# Altium project PCB_Project.PrjPcb
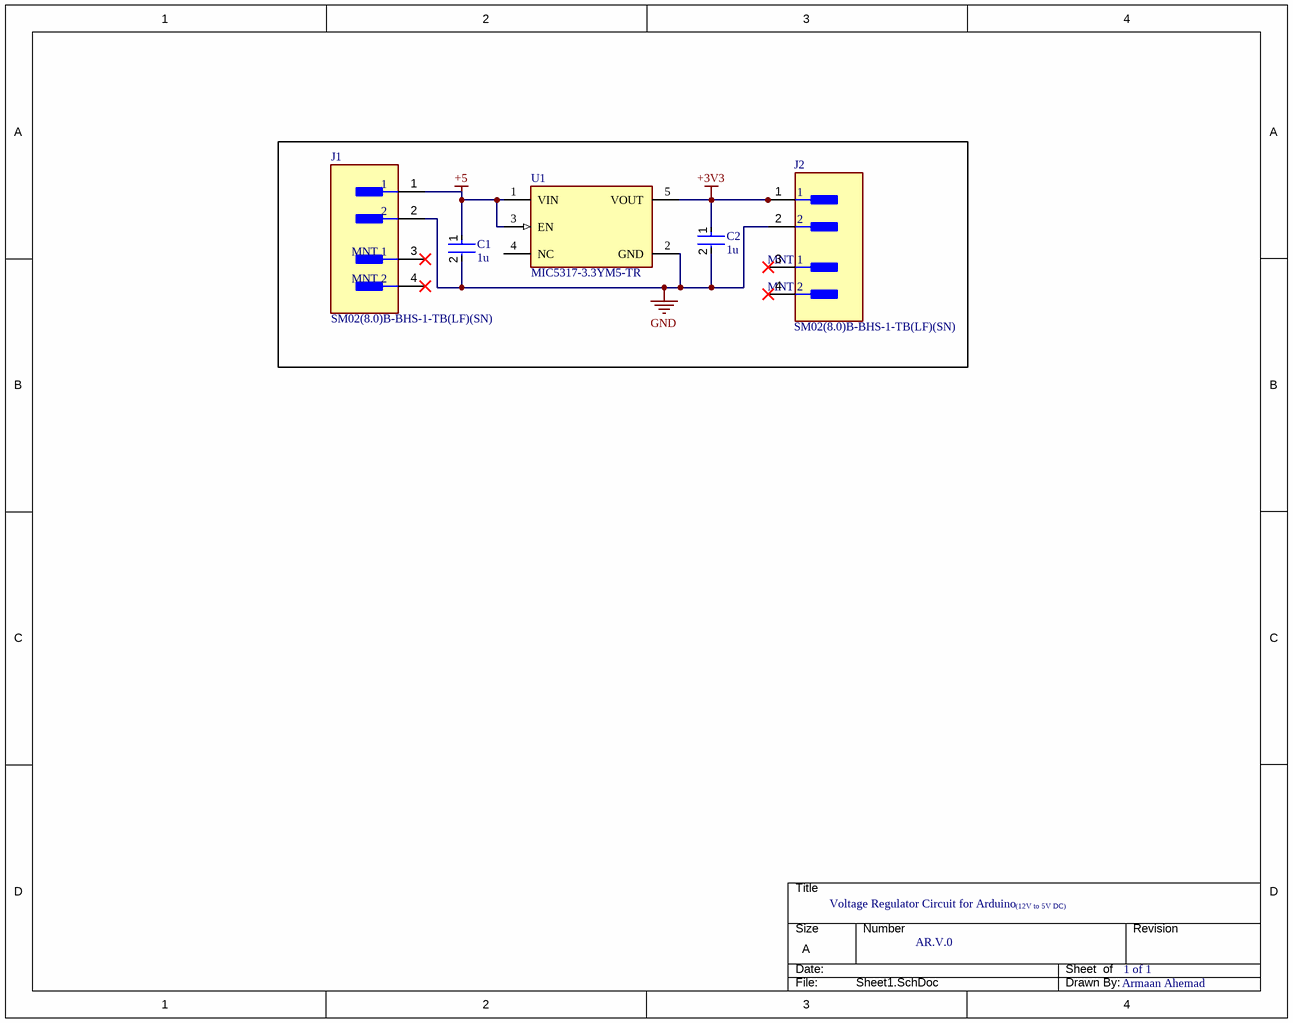
[diagram p0: Sheet1.SchDoc]
1 sheet, 5 parts. Net scope: global (net labels, ports and power ports of the same name join across sheets).
Board file: PCB1.PcbDoc

## Sheet Sheet1.SchDoc
size A; SheetNumber: 1; SheetTotal: 1

### Parts
C1  1u  [FP-CC0805-0_85-MFG]
C2  1u  [FP-CC0805-0_85-MFG]
J1  SM02(8.0)B-BHS-1-TB(LF)(SN)  [FP-SM02_8_0_B-BHS-1-TB_LF-MFG]
J2  SM02(8.0)B-BHS-1-TB(LF)(SN)  [FP-SM02_8_0_B-BHS-1-TB_LF-MFG]
U1  MIC5317-3.3YM5-TR  [FP-SOT23-5LD-PL-1-MFG]

### Nets
+3V3: C2.1 J2.1 U1.5(VOUT)
+5: C1.1 J1.1 U1.1(VIN) U1.3(EN)
GND: C1.2 C2.2 J1.2 J2.2 U1.2(GND)

Not connected (* = marked no-connect by the designer): J1 3(MNT_1)* 4(MNT_2)*; J2 3(MNT_1)* 4(MNT_2)*; U1 4(NC)

### Notes on the sheet
- Voltage Regulator Circuit for Arduino
- (12V to 5V DC)
- AR.V.0
- 1 of 1
- Armaan Ahemad

### Library data of the parts
C1 C2 = CMP-03422-000182-1: CAP CER 1UF 10V X7R 0805; Manufacturer: Yageo; Manufacturer Part Number: CC0805KKX7R6BB105; Material: Ceramic; Description: CC0805 1 uF X7R 10.00% 10 V; Tolerance: 0.1; Value: 1 uF; ComponentLink2URL: http://www.yageo.com/documents/recent/UPY-GPHC_Y5V_6.3V-to-50V_8.pdf; Automotive: No; Temperature Range Low: -30°C; Octopart: https://octopart.com/cc0805kkx7r6bb105-yageo-42522859; Temperature Characteristic: X7R; RoHS: TRUE; Voltage Rating: 10 V; Capacitance: 1 uF; Package: CC0805-0.85; Device Class L3: Ceramic Capacitors; Category: Cap; Mouser Description: Multilayer Ceramic Capacitors MLCC - SMD/SMT 1.0uF 10V X7R 10%; Temperature Range High: +85°C; Ipc Land Pattern Name: CAPC200125X85; ComponentLink2Description: Datasheet; Temperature: -30°C to +85°C; Height: 0.95mm; Lead Free: Yes; Device Class L1: Passive Components; Device Class L2: Capacitors; Footprint Url: http://www.yageo.com/exep/pages/download/literatures/UPY-C_GEN_24.pdf; Digikey Description: CAP CER 1UF 10V X7R 0805
J1 J2 = CMP-17439-000157-1: CONN HEADER SMD R/A 2POS 8MM; Number of Positions: 2; Max Current Rating: 1A; Max Voltage Rating (AC): 600V; Contact Resistance: 20mR; Connector Type: Header; Lead Free: Lead Free; Contact Type: Male Pin; Number of Rows: 1; Contact Plating: Tin; Packaging: Tape and Reel; Depth: 8.6mm; Package Quantity: 1000; Mount: Surface Mount; Insulation Color: Natural; Current Rating: 1A; Fastening Type: Detent; Insulation Material: Nylon; Voltage Rating: 600V; Flammability Rating: UL94 V-0; Contact Finish - Mating: TIN; Orientation: Right Angle; Min Operating Temperature: -25°C; Termination: Solder; Contact Shape: Square; Housing Color: Beige; Max Operating Temperature: 85°C; Housing Material: Polyamide; Pitch: 8mm; Series: BH; Length: 14mm; Number of Contacts: 2; Color: Natural; Contact Material: Copper Alloy
U1 = CMP-06324-000116-1: IC REG LINEAR 3.3V 150MA SOT23-5; Max Input Voltage: 6V; Number of Regulators: 1; Min Current Limit: 200mA; Dropout Voltage: 155mV; Min Input Voltage: 2.5V; Power Supply Rejection Ratio (PSRR): 70dB; Case/Package: SOT-23-5; Output Voltage: 3.3V; Series: -; Max Operating Temperature: 125°C; Package Quantity: 3000; Mount: Surface Mount; Packaging: Tape and Reel; RoHS Compliant: No; Output Current: 150mA; Min Operating Temperature: -40°C; Number of Outputs: 1